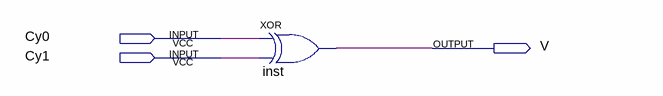
[diagram p0: schematic sheet]
// Quartus schematic V-flag-logic.bdf as structural Verilog: 1 symbols, 3 pins
module \V-flag-logic  (
  input  Cy0,
  input  Cy1,
  output V
);

  xor inst (V, Cy0, Cy1);
endmodule
